# Altium project geared motors.PrjPcb
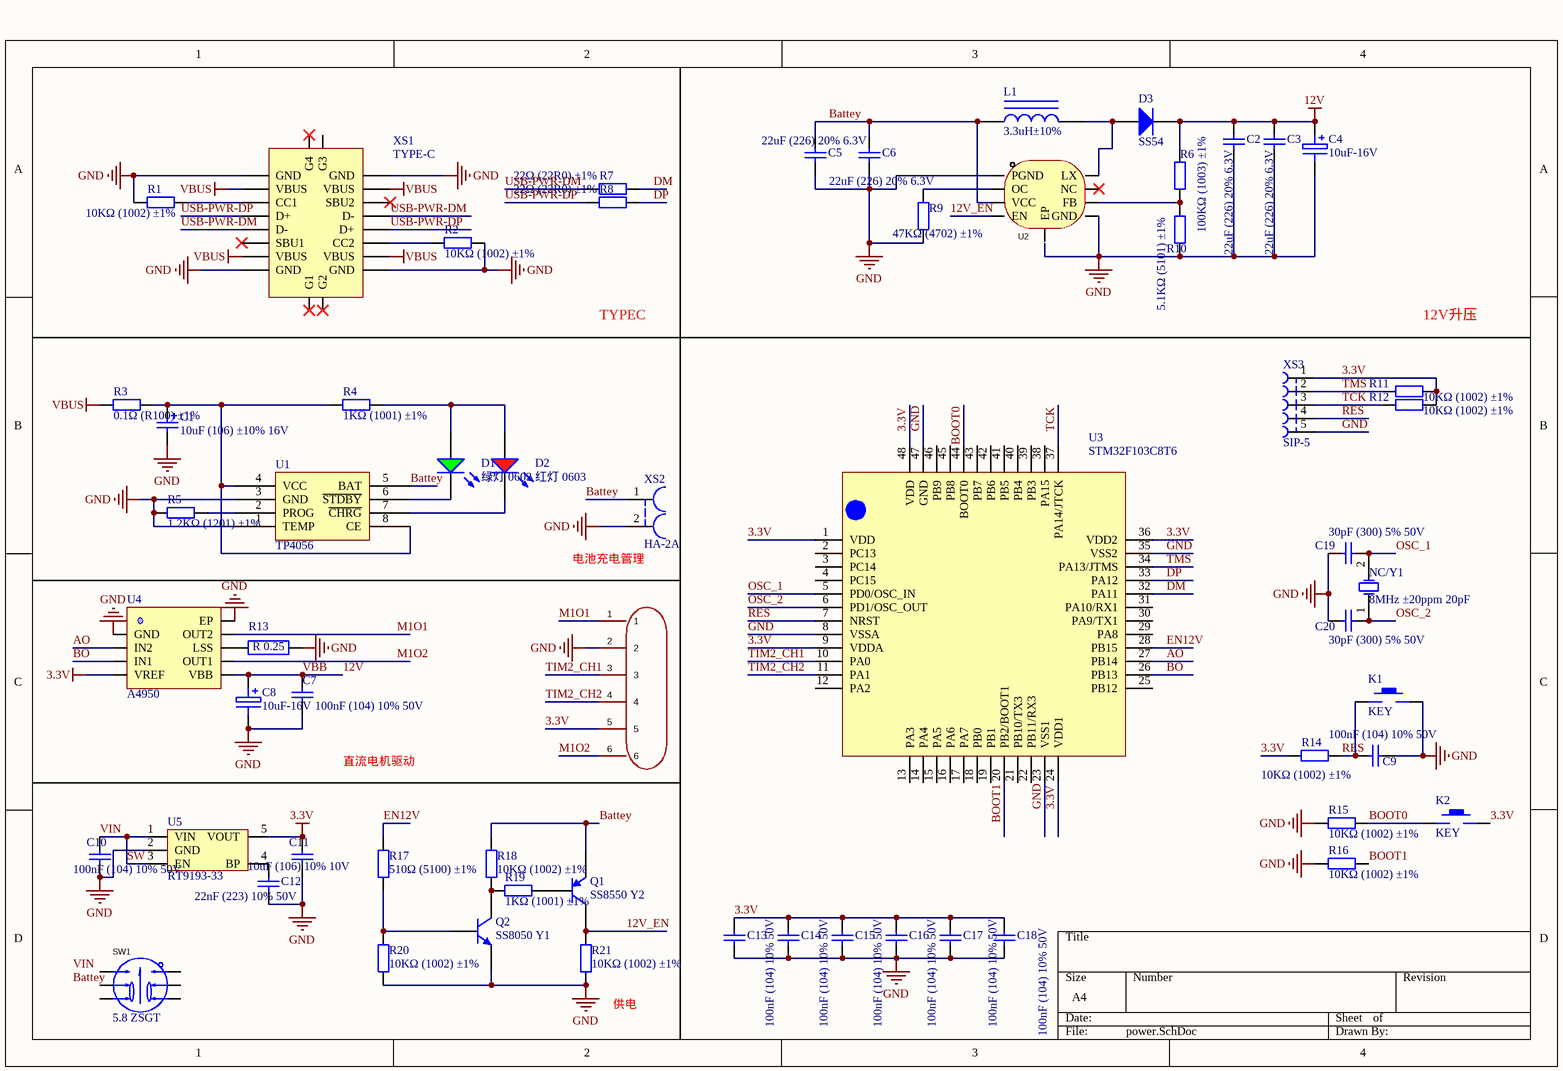
[diagram p0: power.SchDoc]
1 sheet, 60 parts. Net scope: global (net labels, ports and power ports of the same name join across sheets).

## Sheet power.SchDoc
size A4; SheetNumber: 1; SheetTotal: 1

### Parts
C1  10uF (106) ±10% 16V  [CASE-A_3216]
C2  22uF (226) 20% 6.3V  [0603_C]
C3  22uF (226) 20% 6.3V  [0603_C]
C4  10uF-16V  [CAP-B(3528)]
C5  22uF (226) 20% 6.3V  [0603_C]
C6  22uF (226) 20% 6.3V  [0603_C]
C7  100nF (104) 10% 50V  [0603_C]
C8  10uF-16V  [CAP-B(3528)]
C9  100nF (104) 10% 50V  [0603_C]
C10  100nF (104) 10% 50V  [0603_C]
C11  10uF (106) 10% 10V  [0603_C]
C12  22nF (223) 10% 50V  [0603_C]
C13  100nF (104) 10% 50V  [0603_C]
C14  100nF (104) 10% 50V  [0603_C]
C15  100nF (104) 10% 50V  [0603_C]
C16  100nF (104) 10% 50V  [0603_C]
C17  100nF (104) 10% 50V  [0603_C]
C18  100nF (104) 10% 50V  [0603_C]
C19  30pF (300) 5% 50V  [0603_C]
C20  30pF (300) 5% 50V  [0603_C]
CN1  b6b-ph-k-s(lf)(sn)  [CONN-TH_B6B-PH-K-S]  (value not drawn)
D1  绿灯 0603  [0603_LED_S1]
D2  红灯 0603  [0603_LED_S1]
D3  SS54  [SMA(DO-214AC)_S1]
K1  KEY  [KEY2]
K2  KEY  [KEY2]
L1  3.3uH±10%  [0805_L]
NC/Y1  8MHz ±20ppm 20pF  [SMD-5032_2P]
Q1  SS8550 Y2  [SOT-23(SOT-23-3)]
Q2  SS8050 Y1  [SOT-23(SOT-23-3)]
R1  10KΩ (1002) ±1%  [0603_R]
R2  10KΩ (1002) ±1%  [0603_R]
R3  0.1Ω (R100) ±1%  [1206_R]
R4  1KΩ (1001) ±1%  [0603_R]
R5  1.2KΩ (1201) ±1%  [0603_R]
R6  100KΩ (1003) ±1%  [0603_R]
R7  22Ω (22R0) ±1%  [0603_R]
R8  22Ω (22R0) ±1%  [0603_R]
R9  47KΩ (4702) ±1%  [0603_R]
R10  5.1KΩ (5101) ±1%  [0603_R]
R11  10KΩ (1002) ±1%  [0603_R]
R12  10KΩ (1002) ±1%  [0603_R]
R13  R 0.25  [2512_R]
R14  10KΩ (1002) ±1%  [0603_R]
R15  10KΩ (1002) ±1%  [0603_R]
R16  10KΩ (1002) ±1%  [0603_R]
R17  510Ω (5100) ±1%  [0603_R]
R18  10KΩ (1002) ±1%  [0603_R]
R19  1KΩ (1001) ±1%  [0603_R]
R20  10KΩ (1002) ±1%  [0603_R]
R21  10KΩ (1002) ±1%  [0603_R]
SW1  5.8 ZSGT  [SW-TH_5.8ZSGT]
U1  TP4056  [SOP-8_EP_150mil]
U2  FP6293XR-G1  [SOP-8_L4.9-W3.9-P1.27-LS6.0-BL-EP]  (value not drawn)
U3  STM32F103C8T6  [LQFP-48]
U4  A4950  [SOIC-8_EP_150mil]
U5  RT9193-33  [SOT-23-5]
XS1  TYPE-C  [Type-C-TOP]
XS2  HA-2A  [HA-2A]
XS3  SIP-5  [SIP-5]

### Nets
3.3V: C11.2 C13.2 C14.2 C15.2 C16.2 C17.2 C18.2 CN1.5 K2.2 R11.2 R12.2 R14.1 U3.1(VDD) U3.9(VDDA) U3.24(VDD1) U3.36(VDD2) U3.48(VDD) U4.4(VREF) U5.5(VOUT) XS3.1
12V: C2.2 C3.2 C4.1 C7.2 C8.1 D3.2(K) R6.2 U4.5(VBB)  [also labelled VBB]
GND: C1.2 C2.1 C3.1 C4.2 C5.1 C6.1 C7.1 C8.2 C9.2 C10.1 C11.1 C12.2 C13.1 C14.1 C15.1 C16.1 C17.1 C18.1 C19.1 C20.1 CN1.2 K1.2 Q2.2(E) R1.2 R2.1 R5.1 R9.1 R10.1 R13.2 R15.1 R16.1 R20.2 R21.1 U1.1(TEMP) U1.3(GND) U2.1(PGND) U2.5(GND) U3.8(VSSA) U3.23(VSS1) U3.35(VSS2) U3.47(GND) U4.0(EP) U4.1(GND) U5.2(GND) XS1.A1B12(GND) XS1.A12B1(GND) XS2.2 XS3.5
VBUS: R3.1 XS1.A4B9(VBUS) XS1.A9B4(VBUS)
12V_EN: Q1.3(C) R21.2 U2.4(EN)
AO: U3.27(PB14) U4.2(IN2)
Battey: C5.2 C6.2 L1.1 Q1.2(E) R18.2 U1.5(BAT) U2.3(VCC) XS2.1
BO: U3.26(PB13) U4.3(IN1)
BOOT0: K2.1 R15.2 U3.44(BOOT0)
BOOT1: R16.2 U3.20(PB2/BOOT1)
DM: R7.2 U3.32(PA11)
DP: R8.2 U3.33(PA12)
EN12V: R17.2 U3.28(PB15)
M1O1: CN1.1 U4.8(OUT2)
M1O2: CN1.6 U4.6(OUT1)
OSC_1: C19.2 NC/Y1.2(OSC2) U3.5(PD0/OSC_IN)
OSC_2: C20.2 NC/Y1.1(OSC1) U3.6(PD1/OSC_OUT)
RES: C9.1 K1.1 R14.2 U3.7(NRST) XS3.4
SW: C10.2 U5.1(VIN) U5.3(EN)  [also labelled VIN]
TCK: R12.1 U3.37(PA14/JTCK) XS3.3
TIM2_CH1: CN1.3 U3.10(PA0)
TIM2_CH2: CN1.4 U3.11(PA1)
TMS: R11.1 U3.34(PA13/JTMS) XS3.2
USB-PWR-DM: R7.1 XS1.A7(D-) XS1.B7(D-)
USB-PWR-DP: R8.1 XS1.A6(D+) XS1.B6(D+)
NetC1_1: C1.1 R3.2 R4.1 U1.4(VCC) U1.8(CE)
NetC12_1: C12.1 U5.4(BP)
NetD1_A: D1.A D2.A R4.2
NetD1_K: D1.K U1.6(~{STDBY})
NetD2_K: D2.K U1.7(~{CHRG})
NetD3_1: D3.1(A) L1.2 U2.8(LX)
NetQ1_1: Q1.1(B) R19.2
NetQ2_1: Q2.1(B) R17.1 R20.1
NetQ2_3: Q2.3(C) R18.1 R19.1
NetR1_1: R1.1 XS1.A5(CC1)
NetR2_2: R2.2 XS1.B5(CC2)
NetR5_2: R5.2 U1.2(PROG)
NetR6_1: R6.1 R10.2 U2.6(FB)
NetR9_2: R9.2 U2.2(OC)
NetR13_1: R13.1 U4.7(LSS)

Not connected (* = marked no-connect by the designer): SW1 1 2 3 4 5 6; U2 7(NC)* 9(EP); U3 2(PC13) 3(PC14) 4(PC15) 12(PA2) 13(PA3) 14(PA4) 15(PA5) 16(PA6) 17(PA7) 18(PB0) 19(PB1) 21(PB10/TX3) 22(PB11/RX3) 25(PB12) 29(PA8) 30(PA9/TX1) 31(PA10/RX1) 38(PA15) 39(PB3) 40(PB4) 41(PB5) 42(PB6) 43(PB7) 45(PB8) 46(PB9); XS1 0(G1)* A8(SBU1)* B8(SBU2)*

### Notes on the sheet
- TYPEC
- 12V升压
- 电池充电管理
- 直流电机驱动
- (near R21) 供电
- Labels drawn without touching a wire or pin: Battey, VIN

### Library data of the parts
C1 = 3216 10uF (106) 10% 16V: 钽电容; ComponentLink1Description: 供应商链接; ComponentLink1URL: http://www.szlcsc.com/product/details_7643.html; Package: 3216; Supplier: LC; SuppliersPartNumber: C7171
C2 C3 C5 C6 = 0603 22uF (226) 20% 6.3V: 贴片电容; ComponentLink1Description: 供应商链接; ComponentLink1URL: http://www.szlcsc.com/product/details_60514.html; Package: 0603; Supplier: LC; SuppliersPartNumber: C59461
C4 C8 = C-10uF-16V-B型钽电解电容: 10uF-16V-K-B型
C7 C9 C10 C13-C18 = 0603 100nF (104) 10% 50V: 贴片电容; ComponentLink1Description: 供应商链接; ComponentLink1URL: http://www.szlcsc.com/product/details_15331.html; Package: 0603; Supplier: LC; SuppliersPartNumber: C14663
C11 = 0603 10uF (106) 10% 10V: 贴片电容; ComponentLink1Description: 供应商链接; ComponentLink1URL: http://www.szlcsc.com/product/details_20411.html; Package: 0603; Supplier: LC; SuppliersPartNumber: C19702
C12 = 0603 22nF (223) 10% 50V: 贴片电容; ComponentLink1Description: 供应商链接; ComponentLink1URL: http://www.szlcsc.com/product/details_21834.html; Package: 0603; Supplier: LC; SuppliersPartNumber: C21122
C19 C20 = 0603 30pF (300) 5% 50V: 贴片电容; ComponentLink1Description: 供应商链接; ComponentLink1URL: http://www.szlcsc.com/product/details_23122.html; Package: 0603; Supplier: LC; SuppliersPartNumber: C22397
CN1 = PH2.0 1*6p: 插针结构:1x6P;间距:2mm;安装方式:直插;参考系列:PH;总PIN数:6P;排数:1;每排PIN数:6;行距:-;额定电流:2A;触头材质:黄铜;触头镀层:锡;工作温度:-25℃~+85℃;; Manufacturer: JST; AddInBom: yes; ModelId: 70263c758ebc4cfe99105d0efb90d4a3; ModelTransform: 551.21937,177.165,0,0,0,0,0,22.205,-133.858; Pins Structure: 1x6P; Pitch: 2mm; Reference Series: PH; Number of PINs Per Row: 6; Current Rating: 2A; Voltage Rating: 100V; Plastic Material: PA66; Flame Retardant Rating: UL94V-0; Supplementary Features: 打K脚; Z-Height of the Board: 6mm; X-Length of Bottom Edge on Board (Spacing Line): 13.9mm; Y-Width of Bottom Edge on Board: 4.5mm; Symbol: B6B-PH-K-S(LF)(SN); LCSC Part Name: 1x6P 间距:2mm 直插 系列:PH; SupplierPart: C131342; ManufacturerPart: B6B-PH-K-S(LF)(SN); Supplier Footprint: 插件,P=2mm; JLCPCB Part Class: Extended Part; Datasheet: https://item.szlcsc.com/datasheet/B6B-PH-K-S(LF)(SN)/142635.html; Supplier: LCSC; ConvertToPcb: yes; FootprintName: CONN-TH_B6B-PH-K-S; ModelName: CONN-TH_B6B-PH-K-S; Mounting Type: 直插; Number of Pins: 6P; Number of Rows: 1; Row Spacing: -; Contact Material: 黄铜; Contact Plating: 锡; Operating Temperature: -25℃~+85℃; Color: 白色; Supplier Part: C131342
D1 = 0603 绿灯: 发光二极管; ComponentLink1Description: 供应商链接; ComponentLink1URL: http://www.szlcsc.com/product/details_73152.html; Package: 0603; Supplier: LC; SuppliersPartNumber: C72043
D2 = 0603 红灯: 发光二极管; ComponentLink1Description: 供应商链接; ComponentLink1URL: http://www.szlcsc.com/product/details_2659.html; Package: 0603; Supplier: LC; SuppliersPartNumber: C2286
D3 = SMA(DO-214AC) SS54: 二极管; ComponentLink1Description: 供应商链接; ComponentLink1URL: http://www.szlcsc.com/product/details_23178.html; Package: SMA(DO-214AC); Supplier: LC; SuppliersPartNumber: C22452
K1 K2 = KEY_PIN2: 微动 贴片2脚
L1 = 0805 3.3uH10%: 贴片电感; ComponentLink1Description: 供应商链接; ComponentLink1URL: http://www.szlcsc.com/product/details_52738.html; Package: 0805; Supplier: LC; SuppliersPartNumber: C51725
NC/Y1 = SMD-5032_2P 8MHz 20ppm 20pF: 贴片晶振; ComponentLink1Description: 供应商链接; ComponentLink1URL: http://www.szlcsc.com/product/details_117214.html; Package: SMD-5032_2P; Supplier: LC; SuppliersPartNumber: C115962
Q1 = SOT-23 SS8550 Y2: 三极管; ComponentLink1Description: 供应商链接; ComponentLink1URL: http://www.szlcsc.com/product/details_9037.html; Package: SOT-23; Supplier: LC; SuppliersPartNumber: C8542
Q2 = SOT-23 SS8050 Y1: 三极管; ComponentLink1Description: 供应商链接; ComponentLink1URL: http://www.szlcsc.com/product/details_2507.html; Package: SOT-23; Supplier: LC; SuppliersPartNumber: C2150
R1 R2 R11 R12 R14-R16 R18 R20 R21 = 0603 10KΩ (1002) 1%: 贴片电阻; ComponentLink1Description: 供应商链接; ComponentLink1URL: http://www.szlcsc.com/product/details_26547.html; Package: 0603; Supplier: LC; SuppliersPartNumber: C25804
R3 = 1206 0.1Ω (R100) 1%: 贴片电阻; ComponentLink1Description: 供应商链接; ComponentLink1URL: http://www.szlcsc.com/product/details_26077.html; Package: 1206; Supplier: LC; SuppliersPartNumber: C25334
R4 R19 = 0603 1KΩ (1001) 1%: 贴片电阻; ComponentLink1Description: 供应商链接; ComponentLink1URL: http://www.szlcsc.com/product/details_21904.html; Package: 0603; Supplier: LC; SuppliersPartNumber: C21190
R5 = 0603 1.2KΩ (1201) 1%: 贴片电阻; ComponentLink1Description: 供应商链接; ComponentLink1URL: http://www.szlcsc.com/product/details_23492.html; Package: 0603; Supplier: LC; SuppliersPartNumber: C22765
R6 = 0603 100KΩ (1003) 1%: 贴片电阻; ComponentLink1Description: 供应商链接; ComponentLink1URL: http://www.szlcsc.com/product/details_26546.html; Package: 0603; Supplier: LC; SuppliersPartNumber: C25803
R7 R8 = 0603 22Ω (22R0) 1%: 贴片电阻; ComponentLink1Description: 供应商链接; ComponentLink1URL: http://www.szlcsc.com/product/details_24078.html; Package: 0603; Supplier: LC; SuppliersPartNumber: C23345
R9 = 0603 47KΩ (4702) 1%: 贴片电阻; ComponentLink1Description: 供应商链接; ComponentLink1URL: http://www.szlcsc.com/product/details_26562.html; Package: 0603; Supplier: LC; SuppliersPartNumber: C25819
R10 = 0603 5.1KΩ (5101) 1%: 贴片电阻; ComponentLink1Description: 供应商链接; ComponentLink1URL: http://www.szlcsc.com/product/details_23913.html; Package: 0603; Supplier: LC; SuppliersPartNumber: C23186
R13 = R_2512
R17 = 0603 510Ω (5100) 1%: 贴片电阻; ComponentLink1Description: 供应商链接; ComponentLink1URL: http://www.szlcsc.com/product/details_23920.html; Package: 0603; Supplier: LC; SuppliersPartNumber: C23193
SW1 = 自锁按键开关: 30V 双刀双掷 直插 自锁 泡泡机开关; Manufacturer: SHOU HAN(首韩); Add into BOM: yes; Contact Current: 110mA; Insulation Resistance: 100MΩ; Actuator Style: 方形按钮; Actuator/Cap Color: 白色; With Lamp: 无; Pin Style: PC引脚; Operating Force: 150gf@±50gf; Mechanical Life: 100000; Name: 5.8 ZSGT; Symbol: 5.8 ZSGT; Device: 5.8 ZSGT; LCSC Part Name: 5.8*5.8有头/高头 带锁/自锁开关 泡泡机开关; Supplier Part: C2681587; Manufacturer Part: 5.8 ZSGT; Supplier Footprint: 插件; JLCPCB Part Class: Extended Part; Datasheet: https://atta.szlcsc.com/upload/public/pdf/source/20210107/C2681587_CDDDDA4A1C7AC9FEB01815B75893A6BA.pdf; Supplier: LCSC; Convert to PCB: yes; Voltage Rating (DC): 30V; Circuit: 双刀双掷; Mounting Style: 直插; Self Lock / No Lock: 自锁; Operating Temperature: -10℃~+70℃
U1 = TP4056_[C16581]: 电池电源管理; ComponentLink1Description: 供应商链接; ComponentLink1URL: http://www.szlcsc.com/product/details_17264.html; Package: SOP-8_EP_150mil; Supplier: LC; SuppliersPartNumber: C16581
U2 = FP6293XR-G1: DC-DC,工作电压2.6V~5.5V,输出电压13V; Manufacturer: Advanced Analog Technology(类比); Add into BOM: yes; Function: 升压型; Output Voltage: 13V; Output Current: 3.5A; Switching Frequency: 1MHz; Number of Outputs: 1; Topology: 升压式; Switch tube (built-in/external): 内置; Symbol: FP6293XR-G1; Device: FP6293XR-G1; LCSC Part Name: 1MHz, 3.5A升压DC-DC转换器; Supplier Part: C83576; Manufacturer Part: FP6293XR-G1; Supplier Footprint: SOP-8-EP; JLCPCB Part Class: Extended Part; Datasheet: https://atta.szlcsc.com/upload/public/pdf/source/20161012/1476236733261.pdf; Supplier: LCSC; Convert to PCB: yes; Output Type: -; Input Voltage: 2.6V~5.5V; Operating Temperature: -40℃~+85℃; Synchronous Rectification: -; Quiescent Current (Iq): -
U3 = STM32F103C8T6: STM32F103C8T6-LQFP-48
U5 = RT9193-33: 3.3V超低压差LDO
XS1 = TYPE-C: PIN16; SuppliersPartNumber: C2765186
XS2 = HA-2A: HA-2A 白色
XS3 = SIP-5: 单列直插插座-5